# Altium schematic sheet Laser Driver.SchDoc
size A4; DrawnBy: Adam Szautner; Revision: 1.0; SheetNumber: 2; SheetTotal: 2; Prg: Quantum Key Distribution; PrJ: Laser Driver; PN: QKD-LD-002
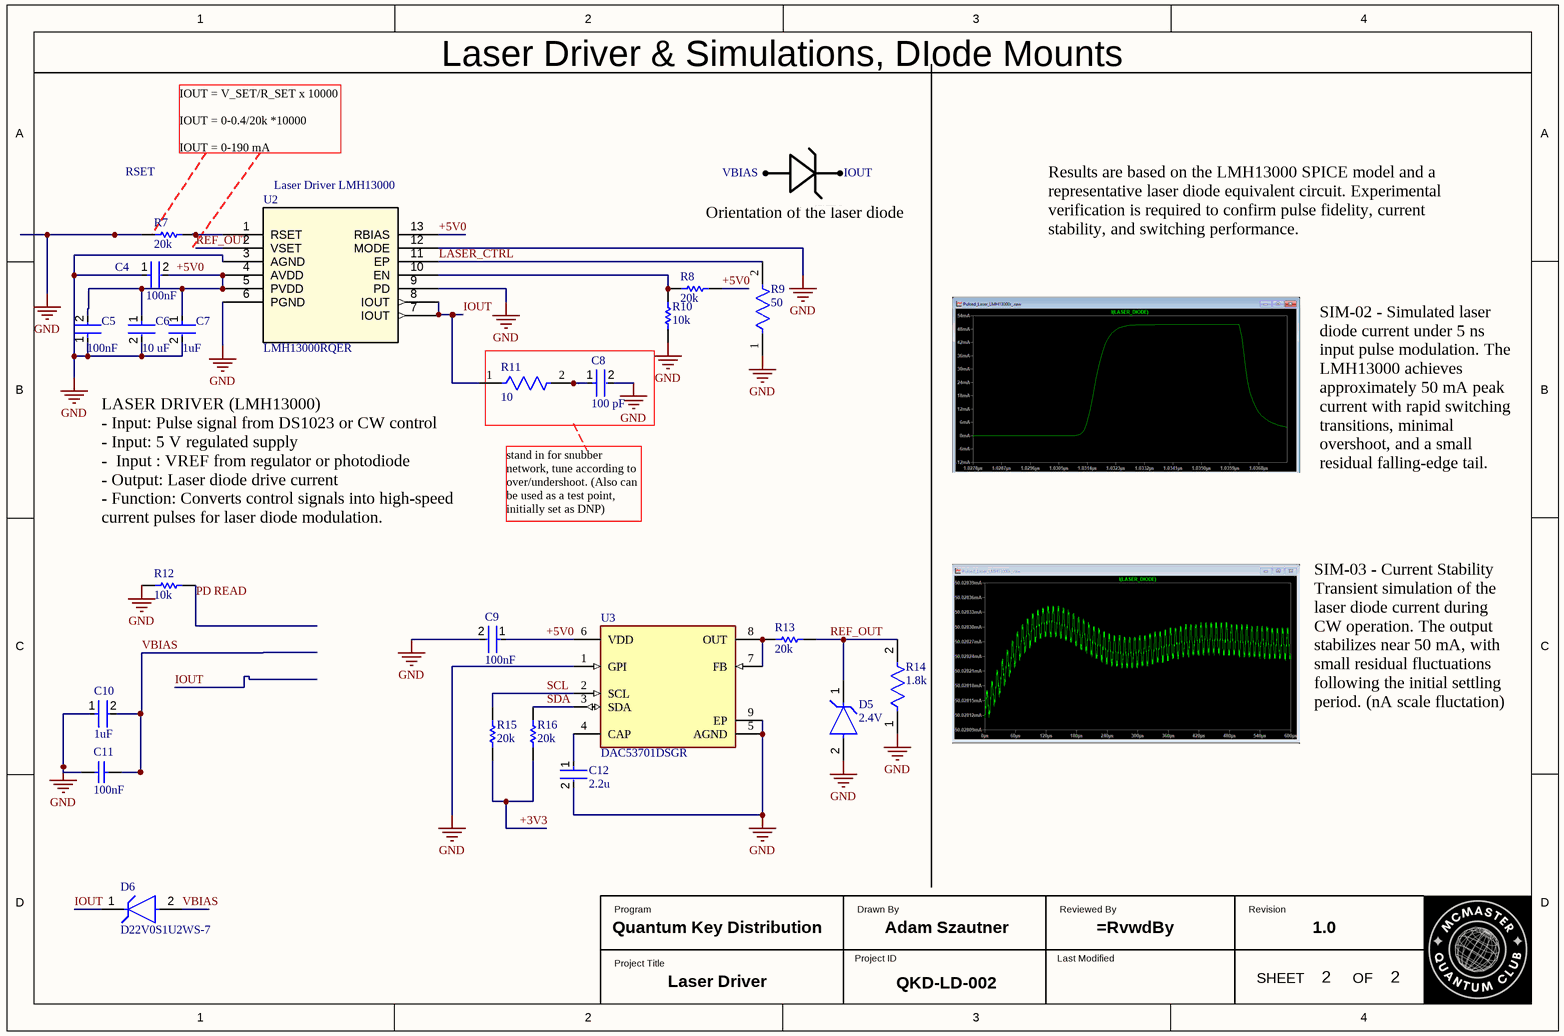
[diagram p0: Laser Driver.SchDoc]

## Parts
C4  100nF  [FP-C0402-BB-MFG]
C5  100nF  [FP-C0402-BB-MFG]
C6  10 uF  [FP-GRM155-0_2-IPC_C]
C7  1uF  [FP-0402-L_1_0_0_05-W_0_5-MFG]
C8  100 pF  [FP-C0402-BB-MFG]
C9  100nF  [FP-C0402-BB-MFG]
C10  1uF  [FP-0402-L_1_0_0_05-W_0_5-MFG]
C11  100nF  [CAPC2013X145X50LL20T20]
C12  2.2u  [FP-GRM155-0_15-MFG]
D5  2.4V  [FP-SOD323-IPC_B]
D6  D22V0S1U2WS-7  [FP-SOD323-IPC_B]
R7  20k  [RESC1005X40X25ML05T05]
R8  20k  [RESC1005X40X25ML05T05]
R9  50  [FP-RT0402-0_35-MFG]
R10  10k  [RESC1005X40X25LL10T10]
R11  10  [FP-TFCR0603-IPC_B]
R12  10k  [RESC1005X40X25LL10T10]
R13  20k  [RESC1005X40X25ML05T05]
R14  1.8k  [FP-RN73R1E-IPC_C]
R15  20k  [RESC1005X40X25ML05T05]
R16  20k  [RESC1005X40X25ML05T05]
U2  LMH13000RQER  [XLMH13000RQER.A_WQFN-HR_TXI_TEX]
U3  DAC53701DSGR  [FP-DSG0008A-IPC_B]

## Nets
GND: C4.1 C5.1 C6.2 C7.2 C8.2 C9.2 C10.1 C11.1 C12.2 D5.2(A) R7.1 R9.1 R10.1 R12.1 R14.1 U2.3(AGND) U2.6(PGND) U2.9(PD) U2.12(MODE) U3.1(GPI) U3.5(AGND) U3.9(EP)
+3V3: R15.2 R16.2
+5V0: C4.2 C5.2 C6.1 C7.1 C9.1 R8.2 U2.4(AVDD) U2.5(PVDD) U2.13(RBIAS) U3.6(VDD)
IOUT: D6.1(C) R11.1 U2.7(IOUT) U2.8(IOUT)
LASER_CTRL: R9.2 U2.11(EP)
PD READ: R12.2
REF_OUT: D5.1(C) R13.2 R14.2 U2.2(VSET)
SCL: R15.1 U3.2(SCL)
SDA: R16.1 U3.3(SDA)
VBIAS: C10.2 C11.2 D6.2(A)
NetC8_1: C8.1 R11.2
NetC12_1: C12.1 U3.4(CAP)
NetR7_2: R7.2 U2.1(RSET)
NetR8_1: R8.1 R10.2 U2.10(EN)
NetR13_1: R13.1 U3.7(FB) U3.8(OUT)

## Notes on the sheet
- Laser Driver & Simulations, DIode Mounts
- RSET
- IOUT = V_SET/R_SET x 10000
  IOUT = 0-0.4/20k *10000
  IOUT = 0-190 mA
- VBIAS
- IOUT
- (near U2) Laser Driver LMH13000
- Orientation of the laser diode
- Results are based on the LMH13000 SPICE model and a representative laser diode equivalent circuit. Experimental verification is required to confirm pulse fidelity, current stability, and switching performance.
- stand in for snubber network, tune according to over/undershoot. (Also can be used as a test point, initially set as DNP)
- SIM-02 - Simulated laser diode current under 5 ns input pulse modulation. The LMH13000 achieves approximately 50 mA peak current with rapid switching transitions, minimal overshoot, and a small residual falling-edge tail.
- LASER DRIVER (LMH13000)
  - Input: Pulse signal from DS1023 or CW control
  - Input: 5 V regulated supply
  -  Input : VREF from regulator or photodiode
  - Output: Laser diode drive current
  - Function: Converts control signals into high-speed current pulses for laser diode modulation.
- SIM-03 - Current Stability
  Transient simulation of the laser diode current during CW operation. The output stabilizes near 50 mA, with small residual fluctuations following the initial settling period. (nA scale fluctation)
- Labels drawn without touching a wire or pin: \
- Program
- Drawn By
- Reviewed By
- Revision
- Project Title
- Project ID
- Last Modified
- SHEET
- OF

## Library data of the parts
C4 C5 C9 = CMP-1034-02069-4: CAP CER 0.1UF 16V 10% X5R 0402; Manufacturer Part Number: C0402C104K4PACTU; Manufacturer: Kemet; Tolerance: 0.1; Value: 0.10 μF; Temperature Coefficient: 15%; Material: Ceramic; Package: C0402-BB; Lead Free: Yes; Voltage Rating: 16 V; Temperature Characteristic: X5R; ComponentLink2URL: https://content.kemet.com/datasheets/KEM_C1002_X7R_SMD.pdf; ComponentLink2Description: Datasheet; Temperature Range Low: -55°C; Device Class L2: Capacitors; Octopart: https://octopart.com/c0402c104k4pactu-kemet-8375715; Device Class L1: Passive Components; Automotive: No; Height: 0.55mm; Mouser Description: Multilayer Ceramic Capacitors MLCC - SMD/SMT 16volts 0.1uF 10% X5R; Digikey Description: CAP CER 0.1UF 16V 10% X5R 0402; Temperature: -55°C to +125°C; Capacitance: 0.10 μF; Device Class L3: Ceramic Capacitors; Temperature Range High: +125°C; RoHS: TRUE; Category: Cap; Ipc Land Pattern Name: CAPC10050X50
C6 = CMP-06035-053439-1: Chip Multilayer Ceramic Capacitors for General Purpose, 0402, 10uF, X5R, 15%, 20%, 10V
C7 C10 = CMP-14477-003599-2: None; RoHS Compliant: Yes
C8 = CMP-03020-017256-1: C0402 100 pF U2J 2.00% 10 V; Manufacturer Part Number: C0402C101G8JACAUTO; Manufacturer: Kemet; Tolerance: 0.02; Material: Ceramic; Temperature Coefficient: 15%; Voltage Rating: 10 V; Device Class L3: Ceramic Capacitors; RoHS: TRUE; Category: Cap; ComponentLink2URL: https://content.kemet.com/datasheets/KEM_C1002_X7R_SMD.pdf; Octopart: https://octopart.com/c0402c101g8jacauto-kemet-84730079; Ipc Land Pattern Name: CAPC10050X50; Temperature Range High: +125°C; Temperature Characteristic: U2J; Automotive: No; Temperature Range Low: -55°C; Value: 100 pF; Package: C0402-BB; Device Class L1: Passive Components; Height: 0.55mm; Temperature: -55°C to +125°C; ComponentLink2Description: Datasheet; Lead Free: Yes; Capacitance: 100 pF; Device Class L2: Capacitors
C11 = CMP-2007-01396-1: Part Number: VJ0805Y104JXXPW1BC; Manufacturer: Vitramon
C12 = CMP-06035-015498-1: Chip Multilayer Ceramic Capacitors for General Purpose, 0402, 2.2uF, X7T, +22%/-33%, 20%, 16V
D5 = CMP-12792-000028-1: DIODE ZENER 2.4V 200MW SOD323; Impedance: 100R; Zener Current: 5mA; Max Reverse Leakage Current: 50uA; ESD Protection: No; Output Current: 50mA; Tolerance: 8%; Element Configuration: Single; Number of Pins: 2; Max Operating Temperature: 150°C; Contact Plating: Tin; Min Operating Temperature: -65°C; REACH SVHC: No SVHC; Power Dissipation: 200mW; Test Current: 5mA; Peak Reverse Current: 50uA; Height: 1mm; Radiation Hardening: No; Termination: SMD/SMT; Power Rating: 200mW; Package Quantity: 3000; Zener Voltage: 2.4V; Max Power Dissipation: 200mW; Lead Free: Lead Free; Weight: 0.000173oz; Width: 1.4mm; Voltage Tolerance: 8%; Voltage Rating (DC): 2.4V; Packaging: Tape and Reel; Mount: Surface Mount; Length: 1.8mm
D6 = CMP-12828-000026-1: TVS DIODE 22V 37V SOD323; Power Line Protection: No; Peak Pulse Power: 1kW; Number of Unidirectional Channels: 1; Peak Pulse Current: 30A; Min Breakdown Voltage: 24V; Composition: Zener; Clamping Voltage: 37V; Mount: Surface Mount; Reverse Standoff Voltage: 22V; Max Operating Temperature: 125°C; Min Operating Temperature: -55°C; Packaging: Tape and Reel
R7 R8 R13 R15 R16 = CMP-2002-08357-1: Manufacturer: Vishay Dale; Part Number: CRCW040220K0FKTD
R9 = CMP-00621-71392720-1: RT0402BRE0750RL Fixed Resistor, Thin Film, 0.0625W, 50ohm, 50V, 0.1% +/-Tol, 50ppm/Cel, Surface Mount, 0402; Max Power Dissipation: 63mW; Temperature Coefficient: 50ppm/°C; Resistance: 50Ω; Features: Moisture Resistant; Max Operating Temperature: 155°C; Tolerance: 0.1%; Min Operating Temperature: -55°C; Case/Package: 0402; Packaging: Tape & Reel; RoHS: Compliant; Width: 508µm; Height: 355.6µm; NexarPartId: 71392720; Composition: Thin Film; Length: 990.6µm; Number of Terminations: 2
R10 R12 = CMP-2002-04584-1: Manufacturer: KOA Speer; Part Number: SG73P1ETTP1002F
R11 = CMP-250906-269177-1: RES Thin Film,  10Ω, 0.5%, 0.1W, 50ppm/°C, 0603
R14 = CMP-04015-046155-1: 1.8kΩ ±0.1% 0.063W, 1/16W Chip Resistor 0402 (1005 Metric) Moisture Resistant Thin Film
U2 = LMH13000RQER: High-speed, voltage-controlled current output driver 13-WQFN-HR -40 to 125; Manufacturer_Name: Texas Instruments; Copyright: Copyright (C) 2025 Ultra Librarian. All rights reserved.; Manufacturer_Part_Number: LMH13000RQER; RefDes: RefDes; Type: Type
U3 = CMP-04861-000027-1: 10-Bit and 8-Bit, Voltage-Output Smart DACs With Nonvolatile Memory and PMBus™ Compatible I2C Interface With GPI Control; RoHS Compliant: Yes